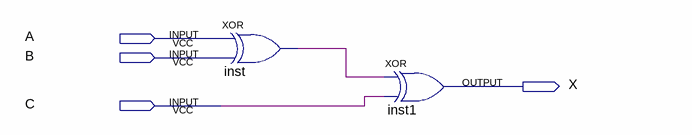
[diagram p0: schematic sheet]
// Quartus schematic XOR_3Custom.bdf as structural Verilog: 2 symbols, 4 pins
module XOR_3Custom (
  input  A,
  input  B,
  input  C,
  output X
);

  wire inst_out;

  xor inst (inst_out, A, B);
  xor inst1 (X, inst_out, C);
endmodule
